# Altium project Power-PCB-v1.0.PrjPcb (part 2 of 2)

## Sheet Main_Power_Sheet.SchDoc
size 420 x 297 mm; SheetNumber: 2; SheetTotal: 3
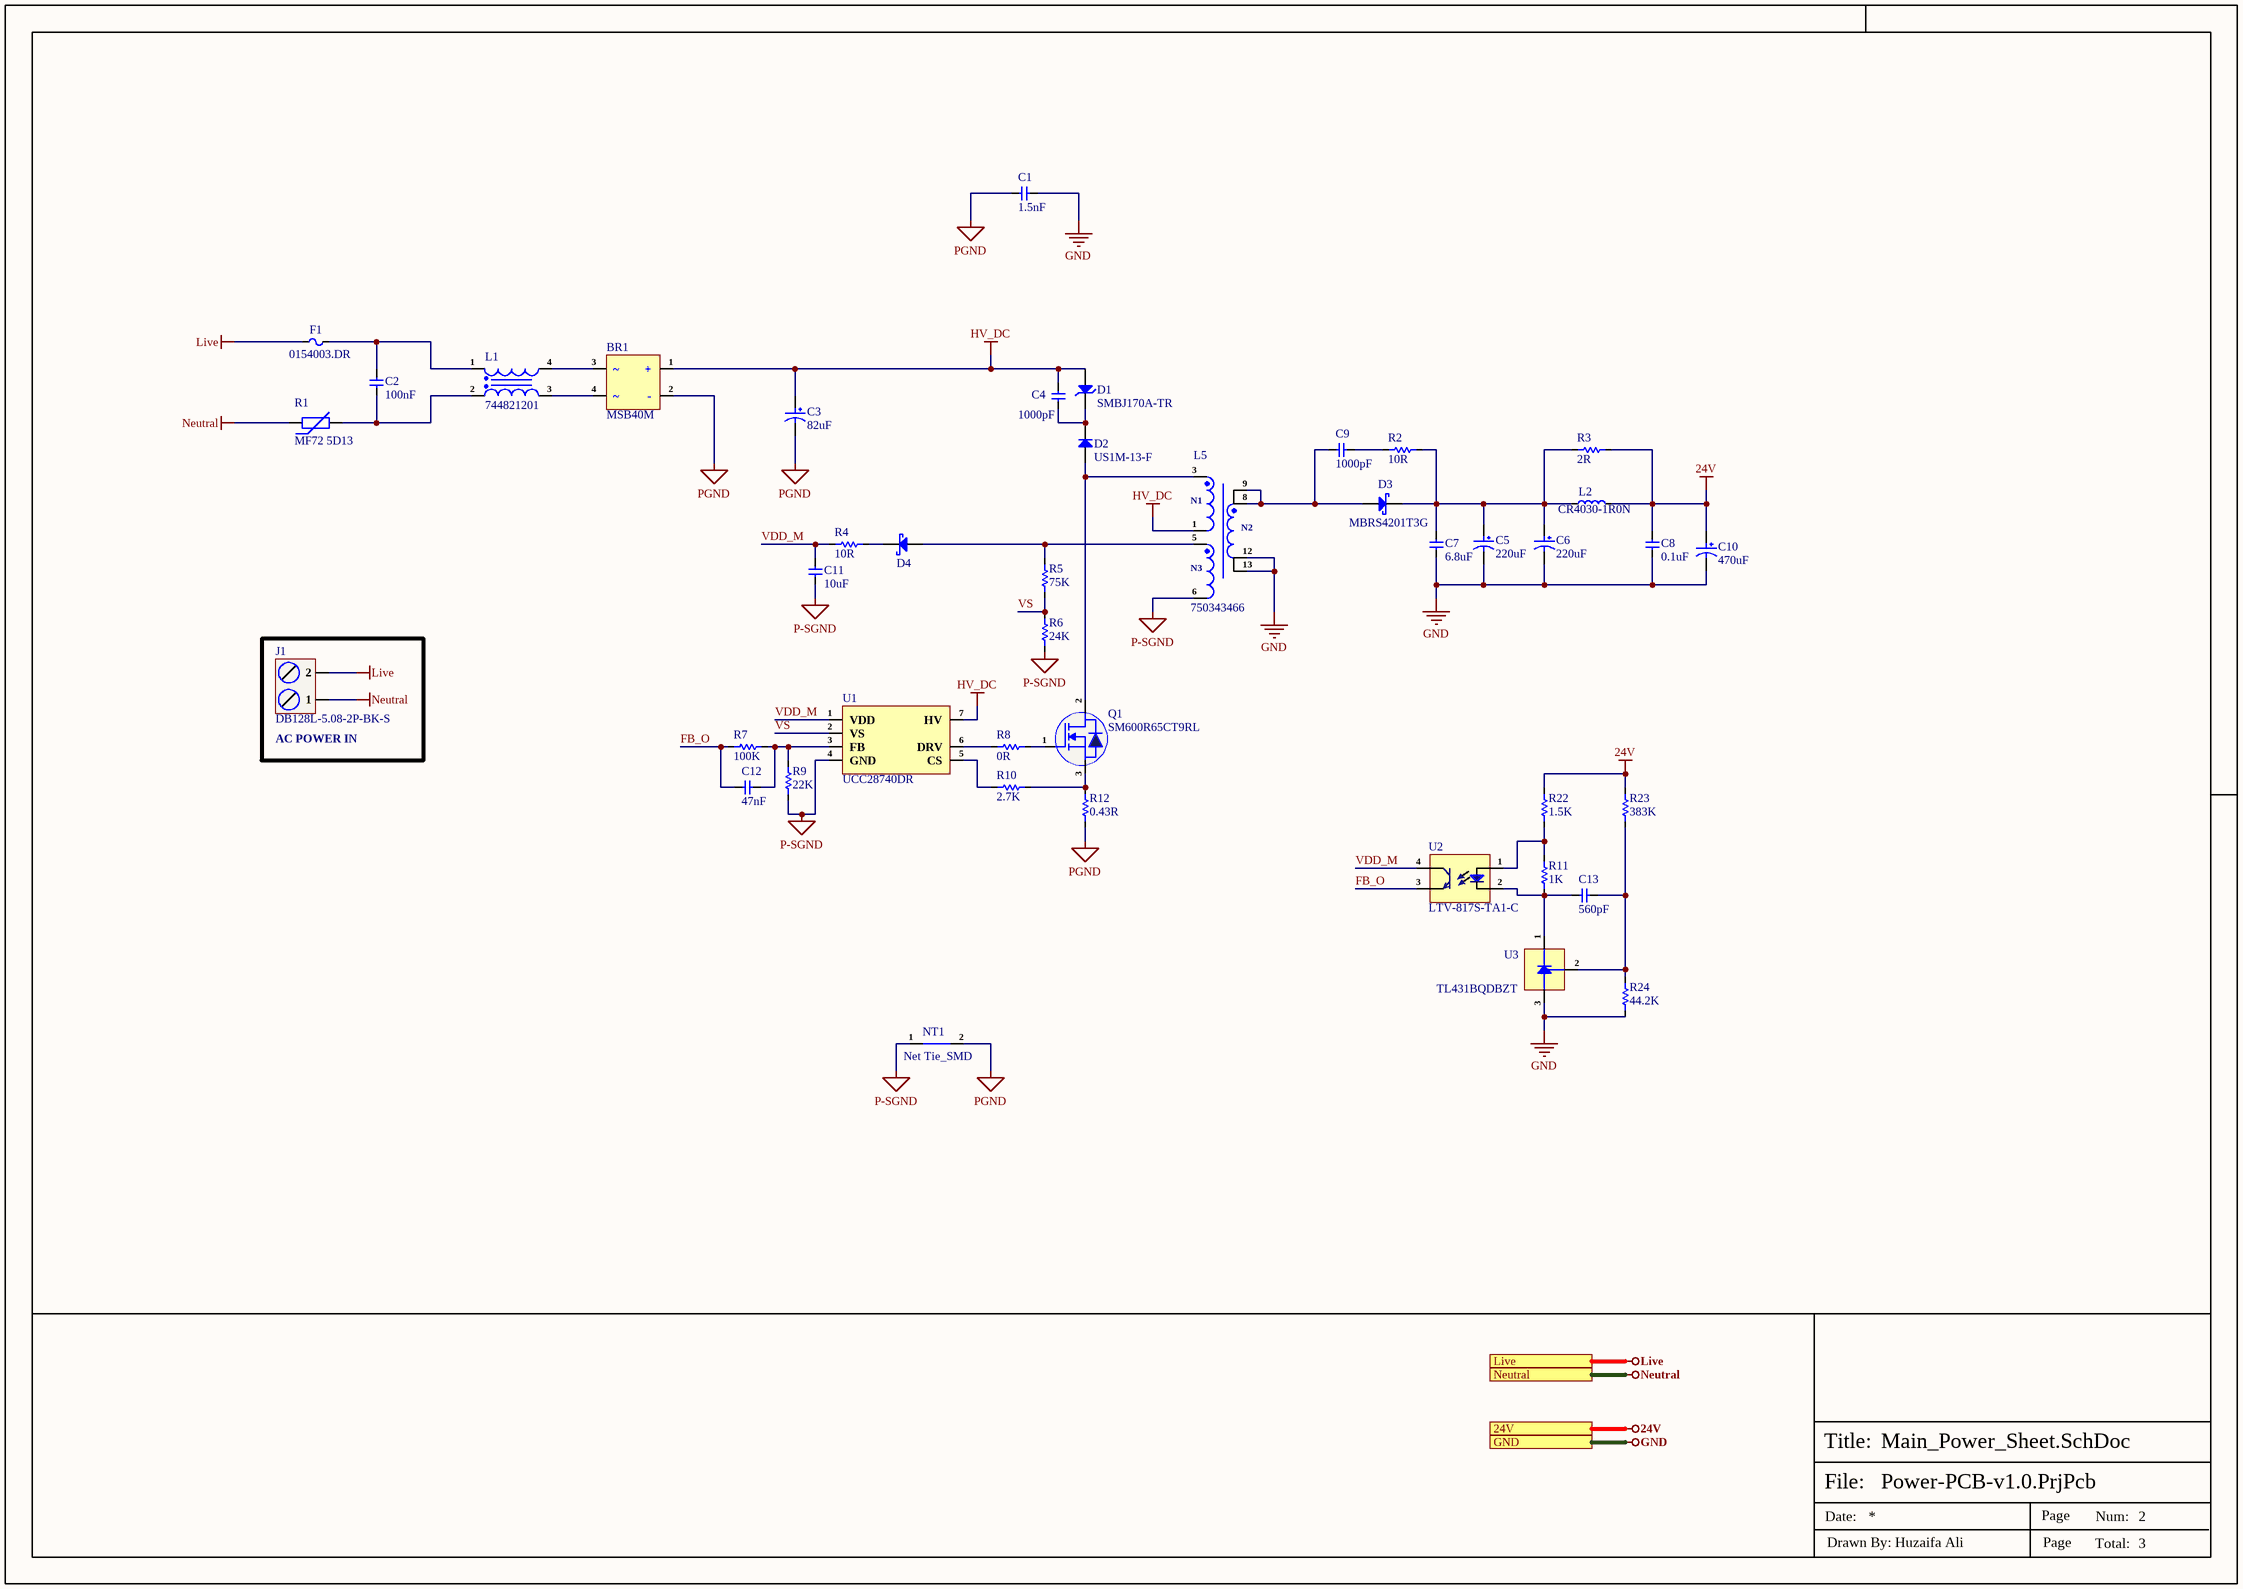
[diagram p2: Main_Power_Sheet.SchDoc]

### Parts
BR1  MSB40M  [UMSB]
C1  1.5nF  [DCF152M36Y5UG6BL0AA]
C2  100nF  [MP2104K27C3X6LC]
C3  82uF  [LKML2002E820MF]
C4  1000pF  [Cap-0805]
C5  220uF  [35ZLH220MEFC8X11.5]
C6  220uF  [35ZLH220MEFC8X11.5]
C7  6.8uF  [Cap-1206]
C8  0.1uF  [Cap-0603]
C9  1000pF  [Cap-0805]
C10  470uF  [ELXZ350ELL471MJ20S]
C11  10uF  [Cap-0805]
C12  47nF  [Cap-0603]
C13  560pF  [Cap-0603]
D1  SMBJ170A-TR  [SMB_]
D2  US1M-13-F  [SMA(DO-214AC)]
D3  MBRS4201T3G  [SMC]
D4  PMEG10010ELRX  [SOD-123W]  (value not drawn)
F1  0154003.DR  [0154003.DR]
J1  DB128L-5.08-2P-BK-S  [DB128L-5.08-2P-BK-S]
L1  744821201  [744821201]
L2  CR4030-1R0N  [CR4030-1R0N]
L5  750343466  [750343466]
NT1  Net Tie_SMD  [Net Tie Pad]  (net tie, no BOM)
Q1  SM600R65CT9RL  [TO-252-2L]
R1  MF72 5D13  [MF72 5D13]
R2  10R  [RES-0805]
R3  2R  [Res-1206]
R4  10R  [RES-0805]
R5  75K  [Res-0603]
R6  24K  [Res-0603]
R7  100K  [Res-0603]
R8  0R  [Res-0603]
R9  22K  [Res-0603]
R10  2.7K  [Res-0603]
R11  1K  [Res-0603]
R12  0.43R  [Res-1206]
R22  1.5K  [Res-0603]
R23  383K  [RES-0805]
R24  44.2K  [Res-0603]
U1  UCC28740DR  [7-SOIC]
U2  LTV-817S-TA1-C  [LTV-817S-TA1-C]
U3  TL431BQDBZT  [SOT-23]

### Blocks framed on the sheet
AC POWER IN: J1

### Ports
24V (see Top_Sheet[2B], DRIVER_BUC_Sheet[4D]), GND (see Top_Sheet[2B], DRIVER_BUC_Sheet[4D]), Live (see Top_Sheet[2B]), Neutral (see Top_Sheet[2B])

### Nets
24V: C8.2 C10.1 L2.2 R3.2 R22.2 R23.2 ; port 24V
GND: C1.2 C5.2 C6.2 C7.1 C8.1 C10.2 L5.12 L5.13 R24.1 U3.3(Anode) ; port GND
HV_DC: BR1.1(+) C3.1 C4.2 D1.1(A) L5.1 U1.7(HV)
Live: F1.1 J1.2 ; port Live
Neutral: J1.1 R1.1 ; port Neutral
P-SGND: C11.1 L5.6 NT1.1 R6.1 R9.1 U1.4(GND)
PGND: BR1.2(-) C1.1 C3.2 NT1.2 R12.1
FB_O: C12.1 R7.1 U2.3(E)
VDD_M: C11.2 R4.1 U1.1(VDD) U2.4(C)
VS: R5.1 R6.2 U1.2(VS)
NetBR1_3: BR1.3 L1.4
NetBR1_4: BR1.4 L1.3
NetC2_1: C2.1 L1.2 R1.2
NetC2_2: C2.2 F1.2 L1.1
NetC4_1: C4.1 D1.2(K) D2.1(K)
NetC5_1: C5.1 C6.1 C7.2 D3.1(K) L2.1 R2.2 R3.1
NetC9_1: C9.1 D3.2(A) L5.8 L5.9
NetC9_2: C9.2 R2.1
NetC12_2: C12.2 R7.2 R9.2 U1.3(FB)
NetC13_1: C13.1 R11.1 U2.2(Ca) U3.1(Cathode)
NetC13_2: C13.2 R23.1 R24.2 U3.2(REF)
NetD2_2: D2.2(A) L5.3 Q1.2(D)
NetD4_1: D4.1(A) L5.5 R5.2
NetD4_2: D4.2(K) R4.2
NetQ1_1: Q1.1(G) R8.2
NetQ1_3: Q1.3(S) R10.2 R12.2
NetR8_1: R8.1 U1.6(DRV)
NetR10_1: R10.1 U1.5(CS)
NetR11_2: R11.2 R22.1 U2.1(An)

### Notes on the sheet
- File:
- Title:
- Date:
- Page
- Num:
- Total:
- Drawn By: Huzaifa Ali
- (in symbol 750343466) N1; N2; N3

### Library data of the parts
BR1 = MSB40M: 1.1V@4A 4A 1000V UMSB Bridge Rectifiers ROHS; Manufacturer: GOODWORK; Item Type: Bridge Rectifire; Manufacturer Part Number: MSB40M; Package: UMSB; LCSC Part Number: C2985033; ComponentLink1Description: LCSC; ComponentLink1URL: https://www.lcsc.com/product-detail/Bridge-Rectifiers_GOODWORK-MSB40M_C2985033.html
C1 = DCF152M36Y5UG6BL0AA: 1.5nF ±20% X1,Y1 Plugin,P=10mm Safety Capacitors ROHS; Manufacturer: SHM; Manufacturer Part Number: DCF152M36Y5UG6BL0AA; Package: Plugin,P=10mm; LCSC Part Number: C2919099; Item Type: Capacitor; ComponentLink1Description: LCSC; ComponentLink1URL: https://www.lcsc.com/product-detail/Safety-Capacitors_SHM-DCF152M36Y5UG6BL0AA_C2919099.html?s_z=n_DE2E3KY152MN3AM02F
C2 = MP2104K27C3X6LC: 100nF ±10% X2 275V Plugin,P=10mm Safety Capacitors ROHS; Manufacturer: SRD(Shenzhen Sincerity Tech); Manufacturer Part Number: MP2104K27C3X6LC; Package: Plugin,P=10mm; LCSC Part Number: C105759; Item Type: Capacitor; ComponentLink1Description: LCSC; ComponentLink1URL: https://www.lcsc.com/product-detail/Safety-Capacitors_SRD-Shenzhen-Sincerity-Tech-MP2104K27C3X6LC_C105759.html
C3 = LKML2002E820MF: 82uF 250V 1.35Ω@100kHz ±20% 1.27A@100kHz Plugin,D12.5xL20mm Aluminum Electrolytic Capacitors - Leaded ROHS; Manufacturer: Ymin; Manufacturer Part Number: LKML2002E820MF; Package: Plugin,D12.5xL20mm; LCSC Part Number: C443261; Item Type: Capacitor; ComponentLink1Description: LCSC; ComponentLink1URL: https://www.lcsc.com/product-detail/Aluminum-Electrolytic-Capacitors-Leaded_Ymin-LKML2002E820MF_C443261.html
C4 C9 = 0805B102K631NT: 630V 1000pF X7R ±10% 0805 Multilayer Ceramic Capacitors MLCC - SMD/SMT ROHS; Manufacturer: FH (Guangdong Fenghua Advanced Tech); Manufacturer Part Number: 0805B102K631NT; Package: 0805; LCSC Part Number: C20617885; Item Type: Capacitor; ComponentLink1Description: LCSC; ComponentLink1URL: https://www.lcsc.com/product-detail/Multilayer-Ceramic-Capacitors-MLCC-SMD-SMT_FH-Guangdong-Fenghua-Advanced-Tech-0805B102K631NT_C20617885.html?s_z=n_%2520C0805C102JBRACTU
C5 C6 = 35ZLH220MEFC8X11.5: 220uF 35V 472.5mA@120Hz ±20% Plugin,D8xL11.5mm Aluminum Electrolytic Capacitors - Leaded ROHS; Manufacturer: Rubycon; Manufacturer Part Number: 35ZLH220MEFC8X11.5; Package: Plugin,D8xL11.5mm; LCSC Part Number: C107639; Item Type: Capacitor; ComponentLink1Description: LCSC; ComponentLink1URL: https://www.lcsc.com/product-detail/Aluminum-Electrolytic-Capacitors-Leaded_Rubycon-35ZLH220MEFC8X11-5_C107639.html?s_z=n_EKZE350ELL221MJC5S
C7 = C3216X7R1V685KT000E: CAP CER 6.8UF 35V X7R 1206; Manufacturer: TDK Corporation; Manufacturer Part Number: C3216X7R1V685K160AC; Item Type: Capacitor; Package: 1206; LCSC Part Number: C342646; ComponentLink1Description: LCSC; ComponentLink1URL: https://www.lcsc.com/product-detail/Multilayer-Ceramic-Capacitors-MLCC-SMD-SMT_TDK-C3216X7R1V685KT000E_C342646.html?s_z=n_C2012X5R1V685K125AC
C8 = GCM188R71H104KA57J: CAP CER 0.1UF 50V X7R 0603; Manufacturer: Murata; Item Type: Capacitors; Material: 4241ConductorMaterial; Value: 100nF; Tolerance: 10%; Supplier: Mouser; LCSC Part Number: 81-GCM188R71H104KA7J; Manufacturer Part Number: GCM188R71H104KA57J; RoHS: Yes; Stock: 469972; Pricing: 1=0.19, 10=0.121, 50=0.121, 100=0.064, 1000=0.051, 10000=0.035 (USD); Mounting Technology: Surface Mount; Case/Package: 0603; Case Code (Metric): 1608; Case Code (Imperial): 0603; Min Operating Temperature: -55°C; Max Operating Temperature: 125°C; Dielectric: X7R; Package Quantity: 1; Packaging: Tape and Reel; Voltage Rating: 50V; Voltage Rating (DC): 50V; Termination: SMD/SMT; Series: GCM; Construction: Flat; Length: 1.6mm; Width: 0.031inch; Height: 0.8mm; Thickness: 0.035inch; Depth: 0.8mm; Ratings: AEC-Q200; Radiation Hardening: No; RoHS Compliant: Yes; Lead Free: 5697LeadFree; ComponentLink1URL: https://datasheet.ciiva.com/29540/product-29540815.pdf?src-supplier=Digikey; ComponentLink1Description: https://datasheet.ciiva.com/29540/product-29540815.pdf?src-supplier=Digikey; ComponentLink2URL: https://datasheet.ciiva.com/11618/product-11618920.pdf?src-supplier=Avnet; ComponentLink2Description: https://datasheet.ciiva.com/11618/product-11618920.pdf?src-supplier=Avnet
C10 = ELXZ350ELL471MJ20S: CAP ALUM 470UF 20% 35V RADIAL; Item Type: Capacitor; Dielectric Material: Aluminium; Ripple Current: 1.22A; ESR (Equivalent Series Resistance): 52mR; Life (Hours): 5000Hour; Lead Diameter: 0.6mm; LCSC Part Number: C1669323; ComponentLink1Description: LCSC; Supplier: Rs; Supplier Part Number: 390120; RoHS: Yes; Category: Aluminum Electrolytic Capacitors; Stock: 615; Pricing: 5=0.094, 25=0.54, 50=0.512, 100=0.488, 250=0.476 (GBP); Mounting Technology: Through Hole; Case/Package: Radial; Min Operating Temperature: -55°C; Max Operating Temperature: 105°C; Value: 470uF; Tolerance: 20%; Voltage Rating: 35V; Package Quantity: 2000; Packaging: Bulk; Impedance: 52mR; Termination: Radial; Voltage Rating (DC): 35V; Series: LXZ; Construction: RADIAL; Diameter: 10mm; Length: 20mm; Height: 20mm; Lead Pitch: 5mm; Ratings: AEC-Q200; Radiation Hardening: No; Lead Free: Lead Free; RoHS Compliant: Yes; Reach SVHC Compliant: Unknown; ComponentLink2URL: https://datasheet.ciiva.com/15165/getdatasheetpartid-102547-15165912.pdf?src-supplier=Verical; ComponentLink2Description: https://datasheet.ciiva.com/15165/getdatasheetpartid-102547-15165912.pdf?src-supplier=Verical; ComponentLink3URL: https://datasheet.ciiva.com/15948/20cat-db-al-cgieejppdfnamelxz-cgieejppdfnamelxz-15948790.pdf?src-supplier=Onlinecomponents.com; ComponentLink3Description: https://datasheet.ciiva.com/15948/20cat-db-al-cgieejppdfnamelxz-cgieejppdfnamelxz-15948790.pdf?src-supplier=Onlinecomponents.com; ComponentLink4URL: https://datasheet.ciiva.com/22620/1697097-22620536.pdf?src-supplier=Element14; ComponentLink4Description: https://datasheet.ciiva.com/22620/1697097-22620536.pdf?src-supplier=Element14; ComponentLink5URL: https://datasheet.ciiva.com/7910/1348889-7910316.pdf?src-supplier=Element14; ComponentLink5Description: https://datasheet.ciiva.com/7910/1348889-7910316.pdf?src-supplier=Element14; ComponentLink6URL: https://datasheet.ciiva.com/29247/447742-da-01-en-elko-470-uf-35v-105c-2000st-29247655.pdf?src-supplier=Conrad; ComponentLink6Description: https://datasheet.ciiva.com/29247/447742-da-01-en-elko-470-uf-35v-105c-2000st-29247655.pdf?src-supplier=Conrad
C11 = CGA0805X5R106K350MT: 35V 10uF X5R ±10% 0805 Multilayer Ceramic Capacitors MLCC - SMD/SMT ROHS; Manufacturer: HRE; Manufacturer Part Number: CGA0805X5R106K350MT; Package: 0805; LCSC Part Number: C6119888; Item Type: Capacitor; ComponentLink1Description: LCSC; ComponentLink1URL: https://www.lcsc.com/product-detail/Multilayer-Ceramic-Capacitors-MLCC-SMD-SMT_HRE-CGA0805X5R106K350MT_C6119888.html?s_z=n_C2012X5R1V106K085AC
C12 = CC0603KRX7R9BB473: CAP CER 0.047UF 50V X7R 0603; Manufacturer: Yageo; Item Type: Capacitors; Material: 4241ConductorMaterial; Supplier: Future Electronics; LCSC Part Number: C107093; Manufacturer Part Number: CC0603KRX7R9BB473; RoHS: Yes; Stock: 2716000; Pricing: 4000=0.003, 16000=0.0029, 60000=0.0028, 160000=0.0027, 400000=0.0026 (USD); Lead Free: 5697LeadFree; Halogen Free: 5694HalogenFree; ComponentLink1URL: https://datasheet.ciiva.com/26862/getdatasheetpartid-403593-26862863.pdf?src-supplier=Verical; ComponentLink1Description: https://datasheet.ciiva.com/26862/getdatasheetpartid-403593-26862863.pdf?src-supplier=Verical; ComponentLink2URL: https://datasheet.ciiva.com/11786/0900766b80d84f1d-11786072.pdf?src-supplier=Rs; ComponentLink2Description: https://datasheet.ciiva.com/11786/0900766b80d84f1d-11786072.pdf?src-supplier=Rs; ComponentLink3URL: https://datasheet.ciiva.com/176/mlccorderingcode-176544.pdf?src-supplier=Digikey; ComponentLink3Description: https://datasheet.ciiva.com/176/mlccorderingcode-176544.pdf?src-supplier=Digikey; ComponentLink4URL: https://datasheet.ciiva.com/176/mlccorderingcode-176545.pdf?src-supplier=Digikey; ComponentLink4Description: https://datasheet.ciiva.com/176/mlccorderingcode-176545.pdf?src-supplier=Digikey; ComponentLink5URL: https://datasheet.ciiva.com/176/mlccorderingcode-176546.pdf?src-supplier=Digikey; ComponentLink5Description: https://datasheet.ciiva.com/176/mlccorderingcode-176546.pdf?src-supplier=Digikey; ComponentLink6URL: https://datasheet.ciiva.com/28450/1489800-28450670.pdf?src-supplier=Element14; ComponentLink6Description: https://datasheet.ciiva.com/28450/1489800-28450670.pdf?src-supplier=Element14
C13 = CC0603KRX7R9BB561: CAP CER 560PF 50V X7R 0603; Manufacturer: Yageo; Item Type: Capacitors; Material: 4241ConductorMaterial; Insulation Resistance: 100GR; Supplier: Digikey; LCSC Part Number: C107094; Manufacturer Part Number: CC0603KRX7R9BB561; RoHS: Yes; Stock: 209062; Pricing: 1=0.1, 10=0.035, 100=0.0204, 1000=0.01285 (USD); Dielectric Material: 4241ConductorMaterial; Voltage Rating (AC): 50V; Lead Free: 5697LeadFree; Halogen Free: 5694HalogenFree; ComponentLink1URL: https://datasheet.ciiva.com/8033/1489800-8033866.pdf?src-supplier=Element14; ComponentLink1Description: https://datasheet.ciiva.com/8033/1489800-8033866.pdf?src-supplier=Element14; ComponentLink2URL: https://datasheet.ciiva.com/144/mlccorderingcode-144466.pdf?src-supplier=Digikey; ComponentLink2Description: https://datasheet.ciiva.com/144/mlccorderingcode-144466.pdf?src-supplier=Digikey; ComponentLink3URL: https://datasheet.ciiva.com/144/mlccorderingcode-144467.pdf?src-supplier=Digikey; ComponentLink3Description: https://datasheet.ciiva.com/144/mlccorderingcode-144467.pdf?src-supplier=Digikey; ComponentLink4URL: https://datasheet.ciiva.com/144/mlccorderingcode-144468.pdf?src-supplier=Digikey; ComponentLink4Description: https://datasheet.ciiva.com/144/mlccorderingcode-144468.pdf?src-supplier=Digikey; ComponentLink5URL: https://datasheet.ciiva.com/11465/upy-gphc-x7r-6-3v-to-50v-8-11465256.pdf?src-supplier=Avnet; ComponentLink5Description: https://datasheet.ciiva.com/11465/upy-gphc-x7r-6-3v-to-50v-8-11465256.pdf?src-supplier=Avnet
D1 = SMBJ170A-TR: TVS DIODE 170VWM 275VC SMB; Manufacturer: STMicroelectronics; Item Type: TVS Diodes; Supplier: Mouser; LCSC Part Number: C1973536; Manufacturer Part Number: SMBJ170A-TR; RoHS: Yes; Stock: 8410; Pricing: 1=0.3, 10=0.231, 50=0.231, 100=0.167, 1000=0.122, 10000=0.115 (USD); ComponentLink1URL: https://datasheet.ciiva.com/30514/2017842-30514067.pdf?src-supplier=Jameco; ComponentLink1Description: https://datasheet.ciiva.com/30514/2017842-30514067.pdf?src-supplier=Jameco; ComponentLink2URL: https://datasheet.ciiva.com/337/cd00001366-337837.pdf?src-supplier=Digikey; ComponentLink2Description: https://datasheet.ciiva.com/337/cd00001366-337837.pdf?src-supplier=Digikey; ComponentLink3URL: https://datasheet.ciiva.com/337/cd00001366-337838.pdf?src-supplier=Digikey; ComponentLink3Description: https://datasheet.ciiva.com/337/cd00001366-337838.pdf?src-supplier=Digikey; ComponentLink4URL: https://datasheet.ciiva.com/337/cd00001366-337839.pdf?src-supplier=Digikey; ComponentLink4Description: https://datasheet.ciiva.com/337/cd00001366-337839.pdf?src-supplier=Digikey; ComponentLink5URL: https://datasheet.ciiva.com/7973/1761316-7973541.pdf?src-supplier=Element14; ComponentLink5Description: https://datasheet.ciiva.com/7973/1761316-7973541.pdf?src-supplier=Element14; ComponentLink6URL: https://datasheet.ciiva.com/7973/1761316-7973543.pdf?src-supplier=Element14; ComponentLink6Description: https://datasheet.ciiva.com/7973/1761316-7973543.pdf?src-supplier=Element14; ComponentLink7URL: https://datasheet.ciiva.com/26817/getdatasheetpartid-82970-26817756.pdf?src-supplier=Verical; ComponentLink7Description: https://datasheet.ciiva.com/26817/getdatasheetpartid-82970-26817756.pdf?src-supplier=Verical; ComponentLink8URL: https://datasheet.ciiva.com/16487/cd00001366-16487614.pdf?src-supplier=Future+Electronics; ComponentLink8Description: https://datasheet.ciiva.com/16487/cd00001366-16487614.pdf?src-supplier=Future+Electronics; ComponentLink9URL: https://datasheet.ciiva.com/14535/70014015-14535806.pdf?src-supplier=Allied+Electronics; ComponentLink9Description: https://datasheet.ciiva.com/14535/70014015-14535806.pdf?src-supplier=Allied+Electronics
D2 = US1M-13-F: DIODE STANDARD 1000V 1A SMA; Manufacturer: Diodes; Value: 10pF; Polarity: 4901Direction; Voltage Rating (DC): 1kV; Supplier: Avnet; LCSC Part Number: C99333; Manufacturer Part Number: US1M-13-F; RoHS: Yes; Item Type: Diodes; Stock: 29030000; Pricing: 5000=0.02564, 10000=0.02516, 20000=0.02503, 30000=0.0249, 40000=0.02477 (USD); Current Rating: 1A; Output Current: 1A; Reverse Voltage: 1kV; Lead Free: 5697LeadFree; ComponentLink1URL: https://datasheet.ciiva.com/27052/1542696-27052440.pdf?src-supplier=Jameco; ComponentLink1Description: https://datasheet.ciiva.com/27052/1542696-27052440.pdf?src-supplier=Jameco; ComponentLink2URL: https://datasheet.ciiva.com/4454/ds16008-60440-4454096.pdf?src-supplier=Mouser; ComponentLink2Description: https://datasheet.ciiva.com/4454/ds16008-60440-4454096.pdf?src-supplier=Mouser; ComponentLink3URL: https://datasheet.ciiva.com/8301/ds16008-8301519.pdf?src-supplier=Avnet; ComponentLink3Description: https://datasheet.ciiva.com/8301/ds16008-8301519.pdf?src-supplier=Avnet; ComponentLink4URL: https://datasheet.ciiva.com/8303/ds16008-8303103.pdf?src-supplier=Avnet; ComponentLink4Description: https://datasheet.ciiva.com/8303/ds16008-8303103.pdf?src-supplier=Avnet; ComponentLink5URL: https://datasheet.ciiva.com/917/ds16008-917195.pdf?src-supplier=Digikey; ComponentLink5Description: https://datasheet.ciiva.com/917/ds16008-917195.pdf?src-supplier=Digikey; ComponentLink6URL: https://datasheet.ciiva.com/917/ds16008-917196.pdf?src-supplier=Digikey; ComponentLink6Description: https://datasheet.ciiva.com/917/ds16008-917196.pdf?src-supplier=Digikey; ComponentLink7URL: https://datasheet.ciiva.com/22695/1906610-22695853.pdf?src-supplier=Element14; ComponentLink7Description: https://datasheet.ciiva.com/22695/1906610-22695853.pdf?src-supplier=Element14
D3 = MBRS4201T3G: 200V Independent Type 4A 860mV@4A SMC(DO-214AB) Schottky Diodes ROHS; Manufacturer: FUXINSEMI; Item Type: Diode; Manufacturer Part Number: MBRS4201T3G; Package: SMC(DO-214AB); LCSC Part Number: C5563749; ComponentLink1Description: LCSC; ComponentLink1URL: https://www.lcsc.com/product-detail/Schottky-Diodes_FUXINSEMI-MBRS4201T3G_C5563749.html?s_z=n_%2520MBRS4201T3G
D4 = PMEG10010ELRX: DIODE SCHOTTKY 100V 1A SOD123W; Manufacturer: Nexperia; Item Type: Schottky Diodes; Reverse Recovery Time: 3.7ns; Value: 28pF; Max Forward Surge Current (Ifsm): 50A; Max Reverse Current: 150nA; Supplier: Future Electronics; LCSC Part Number: C179426; Manufacturer Part Number: PMEG10010ELRX; RoHS: Yes; Stock: 282000; Pricing: 3000=0.0482, 9000=0.047, 15000=0.0464, 30000=0.0457, 60000=0.0446 (USD); Mounting Technology: 8Mount; Average Rectified Current: 1A; Max Reverse Voltage (DC): 100V; Forward Current: 1A; Reverse Voltage: 100V; Height: 1.1mm; RoHS Compliant: Yes; Lead Free: 5697LeadFree; Reach SVHC Compliant: 4186SVHC; ComponentLink1URL: http://www.farnell.com/datasheets/2170364.pdf?src-supplier=Farnell; ComponentLink1Description: http://www.farnell.com/datasheets/2170364.pdf?src-supplier=Farnell; ComponentLink2URL: https://assets.nexperia.com/documents/data-sheet/PMEG10010ELR.pdf?src-supplier=Digikey; ComponentLink2Description: https://assets.nexperia.com/documents/data-sheet/PMEG10010ELR.pdf?src-supplier=Digikey; ComponentLink3URL: https://datasheet.octopart.com/PMEG10010ELRX-Nexperia-datasheet-67796196.pdf?src-supplier=Future+Electronics; ComponentLink3Description: https://datasheet.octopart.com/PMEG10010ELRX-Nexperia-datasheet-67796196.pdf?src-supplier=Future+Electronics; ComponentLink4URL: http://www.farnell.com/datasheets/2170364.pdf?src-supplier=Newark; ComponentLink4Description: http://www.farnell.com/datasheets/2170364.pdf?src-supplier=Newark
F1 = 0154003.DR: FUSE BRD MNT 3A 125VAC/VDC 2SMD; Manufacturer: Littelfuse; Item Type: Fuses; Value: 22.7mR; Supplier: Digikey; LCSC Part Number: C206912; Manufacturer Part Number: 0154003.DR; RoHS: Yes; Stock: 5902; Pricing: 1=2.71, 5=2.246, 10=2.073, 50=1.7196, 100=1.5862, 250=1.425, 500=1.3135 (USD); Lead Free: 5697LeadFree; RoHS Compliant: 5897YesNo; Flammability Rating: 5813Flammability; ComponentLink1URL: https://datasheet.ciiva.com/29697/1708924-29697492.pdf?src-supplier=Jameco; ComponentLink1Description: https://datasheet.ciiva.com/29697/1708924-29697492.pdf?src-supplier=Jameco; ComponentLink2URL: https://datasheet.ciiva.com/14102/aa154xxx-data-e-14102960.pdf?src-supplier=Distrelec; ComponentLink2Description: https://datasheet.ciiva.com/14102/aa154xxx-data-e-14102960.pdf?src-supplier=Distrelec; ComponentLink3URL: https://datasheet.ciiva.com/28499/88932-28499727.pdf?src-supplier=Element14; ComponentLink3Description: https://datasheet.ciiva.com/28499/88932-28499727.pdf?src-supplier=Element14; ComponentLink4URL: https://datasheet.ciiva.com/1268/154-1268659.pdf?src-supplier=Element14; ComponentLink4Description: https://datasheet.ciiva.com/1268/154-1268659.pdf?src-supplier=Element14
J1 = DB128L-5.08-2P-BK-S: 1x2P 18A -40℃~+105℃ 250V Black 12~30 Straight pin 5.08mm 2.5 1 2 Plugin,P=5.08mm Screw terminal ROHS; Manufacturer: DIBO; Item Type: Terminal Block; Manufacturer Part Number: DB128L-5.08-2P-BK-S; Package: Plugin,P=5.08mm; LCSC Part Number: C430601; ComponentLink1Description: LCSC; ComponentLink1URL: https://www.lcsc.com/product-detail/Screw-terminal_span-style-background-color-ff0-DIBO-span-DB128L-5-08-2P-BK-S_C430601.html
L1 = 744821201: CMC 1MH 2A 2LN TH; Manufacturer: Wurth Electronics; Item Type: Fixed Inductors; Supplier: Mouser; Supplier Part Number: 710-744821201; Manufacturer Part Number: 744821201; RoHS: Yes; Stock: 341; Pricing: 1=3.6, 10=3.33, 50=2.98, 100=2.62, 1000=2.34, 10000=2.34 (USD); ComponentLink1URL: https://datasheet.ciiva.com/4952/744821201-87450-4952378.pdf?src-supplier=Mouser; ComponentLink1Description: https://datasheet.ciiva.com/4952/744821201-87450-4952378.pdf?src-supplier=Mouser; ComponentLink2URL: https://datasheet.ciiva.com/1008/744821201-1008592.pdf?src-supplier=Digikey; ComponentLink2Description: https://datasheet.ciiva.com/1008/744821201-1008592.pdf?src-supplier=Digikey; ComponentLink3URL: https://datasheet.ciiva.com/11796/0900766b804ac268-11796620.pdf?src-supplier=Rs; ComponentLink3Description: https://datasheet.ciiva.com/11796/0900766b804ac268-11796620.pdf?src-supplier=Rs; ComponentLink4URL: https://datasheet.ciiva.com/7211/70377-7211245.pdf?src-supplier=Newark; ComponentLink4Description: https://datasheet.ciiva.com/7211/70377-7211245.pdf?src-supplier=Newark; ComponentLink5URL: https://datasheet.ciiva.com/7892/1736513-7892972.pdf?src-supplier=Element14; ComponentLink5Description: https://datasheet.ciiva.com/7892/1736513-7892972.pdf?src-supplier=Element14; ComponentLink6URL: https://datasheet.ciiva.com/14124/to744821201-data-de-14124987.pdf?src-supplier=Distrelec; ComponentLink6Description: https://datasheet.ciiva.com/14124/to744821201-data-de-14124987.pdf?src-supplier=Distrelec
L2 = CR4030-1R0N: 3.4A 1uH ±30% 5.9A SMD,4x4mm Power Inductors ROHS; Manufacturer: Ceaiya; Manufacturer Part Number: CR4030-1R0N; Package: SMD,4x4mm; LCSC Part Number: C520322; Item Type: Inductor; ComponentLink1Description: LCSC; ComponentLink1URL: https://www.lcsc.com/product-detail/Power-Inductors_Ceaiya-CR4030-1R0N_C520322.html?s_z=n_B82462G4102M
L5 = 750343466: XFMR FLYBACK AC/DC CONV 280UH TH; Manufacturer: Wurth Electronics; Item Type: Transformer; Supplier: Digikey; Supplier Part Number: 1297-750343466-ND; Manufacturer Part Number: 750343466; RoHS: Yes; Stock: 112; Pricing: 1=7.36, 10=6.646, 25=6.3768, 70=6.08471, 140=5.89457, 280=5.70964, 490=5.56402, 980=5.38821 (USD); RoHS Compliant: Yes
NT1 = Net Tie_SMD: Net Tie SMD; Manufacturer Part Number: Net Tie; Item Type: Net Tie Pad
Q1 = SM600R65CT9RL: 650V 7A 0.6Ω@10V,3.5A 63W 4V 1 N-channel TO-252-2 MOSFETs ROHS; Manufacturer: SPS; Item Type: Mosfet; Manufacturer Part Number: SM600R65CT9RL; Package: TO-252-2; LCSC Part Number: C509119; ComponentLink1Description: LCSC; ComponentLink1URL: https://www.lcsc.com/product-detail/MOSFETs_SPS-SM600R65CT9RL_C509119.html?s_z=n_TK7P65W
R1 = MF72 5D13: 5Ω 5A 4W 2800K ±10% Plugin,P=7.5mm NTC Thermistors ROHS; Manufacturer: Nanjing Shiheng Elec; Manufacturer Part Number: MF72 5D13; Package: Plugin,P=7.5mm; LCSC Part Number: C72683; Item Type: Thermistor; ComponentLink1Description: LCSC; ComponentLink1URL: https://www.lcsc.com/product-detail/NTC-Thermistors_Nanjing-Shiheng-Elec-MF72-5D13_C72683.html?s_z=n_B57236
R2 R4 = RC0805JR-0710RL: RES 10 OHM 5% 1/8W 0805; Manufacturer: Yageo; Item Type: Resistors; Temperature Coefficient: 200ppm/°C; Voltage Rating: 150V; Power Rating: 125mW; Supplier: Avnet; LCSC Part Number: C137478; Manufacturer Part Number: RC0805JR-0710RL; RoHS: Yes; Stock: 75000; Pricing: 5000=0.00455, 10000=0.00448, 20000=0.00441, 30000=0.00434, 40000=0.00427 (USD); Case/Package: 0805; Contact Plating: Tin,Lead; Case Code (Imperial): 0805; Case Code (Metric): 2012; Min Operating Temperature: -55°C; Max Operating Temperature: 155°C; Tolerance: 5%; Value: 10R; Packaging: Tape and Reel; Resistor Type: Thick Film; Package Quantity: 1; Termination: SMD/SMT; Number of Terminations: 2; Max Power Dissipation: 125mW; Features: Moisture Resistant; Series: RC; Resistance Tolerance: 5%; Length: 0.079inch; Width: 0.049inch; Height: 0.024inch; Lead Free: Lead Free; RoHS Compliant: Yes; Reach SVHC Compliant: Unknown; ComponentLink1URL: https://datasheet.ciiva.com/46395/444164-46395129.pdf?src-supplier=Element14; ComponentLink1Description: https://datasheet.ciiva.com/46395/444164-46395129.pdf?src-supplier=Element14; ComponentLink2URL: https://datasheet.ciiva.com/2456/pyu-r-int-thick-7-2456041.pdf?src-supplier=Digikey; ComponentLink2Description: https://datasheet.ciiva.com/2456/pyu-r-int-thick-7-2456041.pdf?src-supplier=Digikey; ComponentLink3URL: https://datasheet.ciiva.com/2456/pyu-r-int-thick-7-2456042.pdf?src-supplier=Digikey; ComponentLink3Description: https://datasheet.ciiva.com/2456/pyu-r-int-thick-7-2456042.pdf?src-supplier=Digikey; ComponentLink4URL: https://datasheet.ciiva.com/2456/pyu-r-int-thick-7-2456040.pdf?src-supplier=Digikey; ComponentLink4Description: https://datasheet.ciiva.com/2456/pyu-r-int-thick-7-2456040.pdf?src-supplier=Digikey; ComponentLink5URL: https://datasheet.ciiva.com/12667/rc0805-12667031.pdf?src-supplier=Mouser; ComponentLink5Description: https://datasheet.ciiva.com/12667/rc0805-12667031.pdf?src-supplier=Mouser
R3 = FRC1206F2R00TS: 0.25W Thick Film Resistors 200V ±1% ±200ppm/℃ 2Ω 1206 Chip Resistor - Surface Mount ROHS; Manufacturer: FOJAN; Manufacturer Part Number: FRC1206F2R00TS; Package: 1206; LCSC Part Number: C2907381; Item Type: Resistor; ComponentLink1Description: LCSC; ComponentLink1URL: https://www.lcsc.com/product-detail/Chip-Resistor-Surface-Mount_FOJAN-FRC1206F2R00TS_C2907381.html?s_z=n_CRCW12062R00FKEA
R5 = RC0603FR-0775KL: RES 75K OHM 1% 1/10W 0603; Manufacturer: Yageo; Item Type: Resistor; Value: 75kR; Power Rating: 100mW; Voltage Rating: 50V; Temperature Coefficient: 100ppm/°C; Supplier: Future Electronics; LCSC Part Number: C114636; Manufacturer Part Number: RC0603FR-0775KL; RoHS: Yes; Stock: 550000; Pricing: 5000=0.0015, 75000=0.0015, 250000=0.0014, 750000=0.0013, 2500000=0.0012 (USD); Case/Package: 0603; Pins: 2NUMBER; Case Code (Imperial): 0603; Case Code (Metric): 1608; Min Operating Temperature: -55°C; Max Operating Temperature: 155°C; Tolerance: 1%; Packaging: Tape and Reel; Termination: SMD/SMT; Resistor Type: Thick Film; Number of Terminations: 2; Max Power Dissipation: 100mW; Features: Moisture Resistant; Series: RC; Technology: THICK FILM; Resistance Tolerance: 1%; Construction: Rectangular; Voltage Rating (DC): 50V; Length: 1.6mm; Height: 0.45mm; Depth: 0.8mm; RoHS Compliant: Yes; Reach SVHC Compliant: No; Military Standard: Not; Lead Free: 5697LeadFree; ComponentLink1URL: https://datasheet.ciiva.com/11808/0900766b80f96399-11808100.pdf?src-supplier=Rs; ComponentLink1Description: https://datasheet.ciiva.com/11808/0900766b80f96399-11808100.pdf?src-supplier=Rs; ComponentLink2URL: https://datasheet.ciiva.com/15189/getdatasheetpartid-326733-15189816.pdf?src-supplier=Verical; ComponentLink2Description: https://datasheet.ciiva.com/15189/getdatasheetpartid-326733-15189816.pdf?src-supplier=Verical; ComponentLink3URL: https://datasheet.ciiva.com/2455/pyu-r-int-thick-7-2455324.pdf?src-supplier=Digikey; ComponentLink3Description: https://datasheet.ciiva.com/2455/pyu-r-int-thick-7-2455324.pdf?src-supplier=Digikey; ComponentLink4URL: https://datasheet.ciiva.com/2455/pyu-r-int-thick-7-2455325.pdf?src-supplier=Digikey; ComponentLink4Description: https://datasheet.ciiva.com/2455/pyu-r-int-thick-7-2455325.pdf?src-supplier=Digikey; ComponentLink5URL: https://datasheet.ciiva.com/2455/pyu-r-int-thick-7-2455323.pdf?src-supplier=Digikey; ComponentLink5Description: https://datasheet.ciiva.com/2455/pyu-r-int-thick-7-2455323.pdf?src-supplier=Digikey; ComponentLink6URL: https://datasheet.ciiva.com/46395/443971-46395017.pdf?src-supplier=Element14; ComponentLink6Description: https://datasheet.ciiva.com/46395/443971-46395017.pdf?src-supplier=Element14
R6 = RC0603JR-0724KL: RES 24K OHM 5% 1/10W 0603; Manufacturer: Yageo; Item Type: Resistors; Supplier: Digikey; LCSC Part Number: C137644; Manufacturer Part Number: RC0603JR-0724KL; RoHS: Yes; Stock: 92506; Pricing: 1=0.1, 10=0.008, 50=0.0072, 100=0.0061, 500=0.0056, 1000=0.0051 (USD); ComponentLink1URL: http://www.mouser.com/catalog/specsheets/RC0603.pdf?src-supplier=Mouser; ComponentLink1Description: http://www.mouser.com/catalog/specsheets/RC0603.pdf?src-supplier=Mouser; ComponentLink2URL: http://www.yageo.com/documents/recent/PYu-RC_Group_51_RoHS_L_9.pdf?src-supplier=Digikey; ComponentLink2Description: http://www.yageo.com/documents/recent/PYu-RC_Group_51_RoHS_L_9.pdf?src-supplier=Digikey; ComponentLink3URL: http://www.yageo.com/documents/recent/PYu-RC_Group_51_RoHS_L_10.pdf?src-supplier=Digikey; ComponentLink3Description: http://www.yageo.com/documents/recent/PYu-RC_Group_51_RoHS_L_10.pdf?src-supplier=Digikey; ComponentLink4URL: http://www.yageo.com.tw/exep/pages/download/literatures/PYu-R_INT-thick_7.pdf?src-supplier=Digikey; ComponentLink4Description: http://www.yageo.com.tw/exep/pages/download/literatures/PYu-R_INT-thick_7.pdf?src-supplier=Digikey; ComponentLink5URL: https://datasheet.octopart.com/RC0603JR-0724KL-Yageo-datasheet-164759695.pdf?src-supplier=Future+Electronics; ComponentLink5Description: https://datasheet.octopart.com/RC0603JR-0724KL-Yageo-datasheet-164759695.pdf?src-supplier=Future+Electronics; ComponentLink6URL: http://www.yageo.com/documents/recent/PYu-RC0603_51_RoHS_L_7.pdf?src-supplier=Future+Electronics; ComponentLink6Description: http://www.yageo.com/documents/recent/PYu-RC0603_51_RoHS_L_7.pdf?src-supplier=Future+Electronics
R7 = RC0603FR-07100KL: RES 100K OHM 1% 1/10W 0603; Manufacturer: Yageo; Item Type: Resistors; Value: 100kR; Temperature Coefficient: 100ppm/°C; Voltage Rating (DC): 50V; Power Rating: 100mW; Supplier: Rs; LCSC Part Number: C14675; Manufacturer Part Number: RC0603FR-07100KL; RoHS: Yes; Stock: 27300; Case/Package: 0603; Pins: 2; Case Code (Imperial): 0603; Case Code (Metric): 1608; Min Operating Temperature: -55°C; Max Operating Temperature: 155°C; Tolerance: 1%; Resistor Type: Thick Film; Packaging: Tape and Reel; Voltage Rating: 50V; Termination: SMD/SMT; Number of Terminations: 2; Features: Moisture Resistant; Series: RC; Max Power Dissipation: 100mW; Resistance Tolerance: 1%; Construction: Rectangular; Technology: THICK FILM; Length: 1.6mm; Width: 0.8mm; Height: 0.45mm; Depth: 0.8mm; Reach SVHC Compliant: No; Lead Free: 5697LeadFree; Military Standard: Not; RoHS Compliant: Yes; Supplier Part Number: 2424020; Category: Chip SMD Resistors; Mounting Technology: Surface Mount; Weight: 7.1E-05oz; Package Quantity: 5000; ComponentLink1URL: https://datasheet.ciiva.com/11819/0900766b80f96399-11819227.pdf?src-supplier=Rs; ComponentLink1Description: https://datasheet.ciiva.com/11819/0900766b80f96399-11819227.pdf?src-supplier=Rs; ComponentLink2URL: https://datasheet.ciiva.com/2455/pyu-r-int-thick-7-2455183.pdf?src-supplier=Digikey; ComponentLink2Description: https://datasheet.ciiva.com/2455/pyu-r-int-thick-7-2455183.pdf?src-supplier=Digikey; ComponentLink3URL: https://datasheet.ciiva.com/2455/pyu-r-int-thick-7-2455184.pdf?src-supplier=Digikey; ComponentLink3Description: https://datasheet.ciiva.com/2455/pyu-r-int-thick-7-2455184.pdf?src-supplier=Digikey; ComponentLink4URL: https://datasheet.ciiva.com/2455/pyu-r-int-thick-7-2455182.pdf?src-supplier=Digikey; ComponentLink4Description: https://datasheet.ciiva.com/2455/pyu-r-int-thick-7-2455182.pdf?src-supplier=Digikey
R8 = RC0603JR-070RL: RES 0 OHM JUMPER 1/10W 0603; Manufacturer: Yageo; Resistance: 0mR; Tolerance: 1%; Power Rating: 100mW; Voltage Rating (DC): 50V; Temperature Coefficient: 200ppm/°C; Resistance Tolerance: 5%; Item Type: Resistor; Supplier 1: Digi-Key; Manufacturer Part Number: RC0603JR-070RL; RoHS: Yes; Category: Chip SMD Resistors; Stock 1: 18081776; Pricing 1: 1=0.10000, 10=0.01700, 25=0.01240, 50=0.00960, 100=0.00700, 250=0.00536, 500=0.00430, 1000=0.00316 (USD); Case/Package: 0603; Number of Pins: 2; Contact Plating: Tin,Matte; Case Code (Imperial): 0603; Case Code (Metric): 1608; Size Code: 0603; Min Operating Temperature: -55°C; Max Operating Temperature: 155°C; Resistor Type: Thick Film; Packaging: Tape and Reel; Termination: SMD/SMT; Series: RC; Technology: THICK FILM; Package Quantity: 5000; Voltage Rating: 50V; Features: Moisture Resistant; Max Power Dissipation: 100mW; Number of Terminations: 2; Construction: Rectangular; Length: 1.6mm; Width: 0.8mm; Height: 0.45mm; Depth: 0.8mm; Radiation Hardening: No; Reach SVHC Compliant: No SVHC; Lead Free: Lead Free; RoHS Compliant: Yes; Military Standard: Not; Supplier Part Number 1: 311-0.0GRCT-ND; LCSC Part Number: C95177
R9 = RC0603FR-0722KL: RES 22K OHM 1% 1/10W 0603; Manufacturer: Yageo; Item Type: Resistors; Value: 22kR; Temperature Coefficient: 100ppm/°C; Voltage Rating (DC): 50V; Power Rating: 100mW; Shielding: 202Shielding; Current Rating: 290mA; Supplier: Future Electronics; LCSC Part Number: C114065; Manufacturer Part Number: RC0603FR-0722KL; RoHS: Yes; Stock: 1285000; Pricing: 5000=0.0008, 50000=0.0008, 150000=0.0008, 375000=0.0008, 1000000=0.0007 (USD); Case/Package: 0603; Pins: 2; Case Code (Imperial): 0603; Case Code (Metric): 1608; Min Operating Temperature: -55°C; Max Operating Temperature: 155°C; Tolerance: 1%; Resistor Type: Thick Film; Packaging: Tape and Reel; Voltage Rating: 50V; Package Quantity: 1; Termination: SMD/SMT; Number of Terminations: 2; Max Power Dissipation: 100mW; Features: Moisture Resistant; Series: RC; Resistance Tolerance: 1%; Construction: Rectangular; Voltage Rating (AC): 50V; Diameter: 8.5mm; Length: 0.063inch; Width: 0.031inch; Height: 0.022inch; Depth: 0.8mm; Lead Pitch: 5mm; Radiation Hardening: 5898YesNo; Reach SVHC Compliant: No; Lead Free: 5697LeadFree; Military Standard: Not; RoHS Compliant: Yes; ComponentLink1URL: https://datasheet.ciiva.com/2454/pyu-r-int-thick-7-2454424.pdf?src-supplier=Digikey; ComponentLink1Description: https://datasheet.ciiva.com/2454/pyu-r-int-thick-7-2454424.pdf?src-supplier=Digikey; ComponentLink2URL: https://datasheet.ciiva.com/2454/pyu-r-int-thick-7-2454425.pdf?src-supplier=Digikey; ComponentLink2Description: https://datasheet.ciiva.com/2454/pyu-r-int-thick-7-2454425.pdf?src-supplier=Digikey; ComponentLink3URL: https://datasheet.ciiva.com/2454/pyu-r-int-thick-7-2454423.pdf?src-supplier=Digikey; ComponentLink3Description: https://datasheet.ciiva.com/2454/pyu-r-int-thick-7-2454423.pdf?src-supplier=Digikey; ComponentLink4URL: https://datasheet.ciiva.com/7746/443971-7746303.pdf?src-supplier=Element14; ComponentLink4Description: https://datasheet.ciiva.com/7746/443971-7746303.pdf?src-supplier=Element14; ComponentLink5URL: https://datasheet.ciiva.com/15189/getdatasheetpartid-413247-15189661.pdf?src-supplier=Verical; ComponentLink5Description: https://datasheet.ciiva.com/15189/getdatasheetpartid-413247-15189661.pdf?src-supplier=Verical; ComponentLink6URL: https://datasheet.ciiva.com/7746/1686128-7746302.pdf?src-supplier=Element14; ComponentLink6Description: https://datasheet.ciiva.com/7746/1686128-7746302.pdf?src-supplier=Element14; ComponentLink7URL: https://datasheet.ciiva.com/46412/443971-46412846.pdf?src-supplier=Element14; ComponentLink7Description: https://datasheet.ciiva.com/46412/443971-46412846.pdf?src-supplier=Element14
R10 = RC0603JR-072K7L: RES 2.7K OHM 5% 1/10W 0603; Manufacturer: Yageo; Item Type: Resistors; Voltage Rating (AC): 50V; Supplier: Digikey; LCSC Part Number: C127451; Manufacturer Part Number: RC0603JR-072K7L; RoHS: Yes; Stock: 1341093; Pricing: 1=0.1, 10=0.006, 50=0.0056, 100=0.0051, 500=0.00498 (USD); Lead Free: 5697LeadFree; ComponentLink1URL: https://datasheet.ciiva.com/12555/rc0603-272842-12555110.pdf?src-supplier=Mouser; ComponentLink1Description: https://datasheet.ciiva.com/12555/rc0603-272842-12555110.pdf?src-supplier=Mouser; ComponentLink2URL: https://datasheet.ciiva.com/2452/pyu-r-int-thick-7-2452860.pdf?src-supplier=Digikey; ComponentLink2Description: https://datasheet.ciiva.com/2452/pyu-r-int-thick-7-2452860.pdf?src-supplier=Digikey; ComponentLink3URL: https://datasheet.ciiva.com/2452/pyu-r-int-thick-7-2452861.pdf?src-supplier=Digikey; ComponentLink3Description: https://datasheet.ciiva.com/2452/pyu-r-int-thick-7-2452861.pdf?src-supplier=Digikey; ComponentLink4URL: https://datasheet.ciiva.com/2452/pyu-r-int-thick-7-2452862.pdf?src-supplier=Digikey; ComponentLink4Description: https://datasheet.ciiva.com/2452/pyu-r-int-thick-7-2452862.pdf?src-supplier=Digikey
R11 = 0603WAF1001T5E: 0.1W Thick Film Resistors 75V ±100ppm/℃ ±1% 1kΩ 0603 Chip Resistor - Surface Mount ROHS; Manufacturer: UNI-ROYAL(Uniroyal Elec); Manufacturer Part Number: 0603WAF1001T5E; Package: 0603; LCSC Part Number: C21190; Item Type: Resistor; ComponentLink1Description: LCSC; ComponentLink1URL: https://www.lcsc.com/product-detail/Chip-Resistor-Surface-Mount_UNI-ROYAL-Uniroyal-Elec-0603WAF1001T5E_C21190.html?s_z=n_CRCW06031K00JNEA
R12 = FRL1206FR430TS: 0.25W Thick Film Resistors 500V ±1% ±300ppm/℃ 0.43Ω 1206 Chip Resistor - Surface Mount ROHS; Manufacturer: FOJAN; Manufacturer Part Number: FRL1206FR430TS; Package: 1206; LCSC Part Number: C2934294; Item Type: Resistor; ComponentLink1Description: LCSC; ComponentLink1URL: https://www.lcsc.com/product-detail/Chip-Resistor-Surface-Mount_FOJAN-FRL1206FR430TS_C2934294.html?s_z=n_%2520ERJ-8RQFR43V
R22 = RC0603FR-071K5L: RES 1.5K OHM 1% 1/10W 0603; Manufacturer: Yageo; Voltage Rating (DC): 50V; Resistance: 1.5kR; Temperature Coefficient: 100ppm/°C; Power Rating: 100mW; Item Type: Resistor; Supplier 1: Arrow Electronics; Manufacturer Part Number: RC0603FR-071K5L; RoHS: Yes; Category: Chip SMD Resistors; Stock 1: 15000; Pricing 1: 1=0.00160, 5000=0.00160 (USD); Case/Package: 0603; Number of Pins: 2; Case Code (Metric): 1608; Case Code (Imperial): 0603; Size Code: 0603; Min Operating Temperature: -55°C; Max Operating Temperature: 155°C; Tolerance: 1%; Packaging: Tape and Reel; Resistor Type: Thick Film; Voltage Rating: 50V; Package Quantity: 1; Number of Terminations: 2; Termination: SMD/SMT; Max Power Dissipation: 100mW; Features: Moisture Resistant; Series: RC; Resistance Tolerance: 1%; Construction: Rectangular; Length: 0.063inch; Width: 0.031inch; Height: 0.022inch; Depth: 0.8mm; REACH SVHC: No SVHC; Lead Free: Lead Free; Military Standard: Not; RoHS Compliant: Yes; Supplier Part Number 1: RC0603FR-071K5L; LCSC Part Number: C114668
R23 = RT0805BRD07383KL: RES SMD 383K OHM 0.1% 1/8W 0805; Manufacturer: Yageo; Item Type: Resistors; Supplier: Digikey; LCSC Part Number: C865439; Manufacturer Part Number: RT0805BRD07383KL; RoHS: Yes; Pricing: 5000=0.04379 (USD); ComponentLink1URL: https://datasheet.ciiva.com/12706/pyu-rt-1-to-0-05-rohs-l-4-12706709.pdf?src-supplier=Mouser; ComponentLink1Description: https://datasheet.ciiva.com/12706/pyu-rt-1-to-0-05-rohs-l-4-12706709.pdf?src-supplier=Mouser; ComponentLink2URL: https://datasheet.ciiva.com/8885/pyu-rt-1-to-0-05-rohs-l-4-8885958.pdf?src-supplier=Avnet; ComponentLink2Description: https://datasheet.ciiva.com/8885/pyu-rt-1-to-0-05-rohs-l-4-8885958.pdf?src-supplier=Avnet
R24 = RC0603FR-0744K2L: RES 44.2K OHM 1% 1/10W 0603; Manufacturer: Yageo; Item Type: Resistors; Voltage Rating (DC): 50V; Supplier: Digikey; LCSC Part Number: C95684; Manufacturer Part Number: RC0603FR-0744K2L; RoHS: Yes; Stock: 163731; Pricing: 1=0.1, 10=0.009, 100=0.0071, 1000=0.00612, 2500=0.00461 (USD); Lead Free: 5697LeadFree; ComponentLink1URL: https://datasheet.ciiva.com/11819/0900766b80f96399-11819371.pdf?src-supplier=Rs; ComponentLink1Description: https://datasheet.ciiva.com/11819/0900766b80f96399-11819371.pdf?src-supplier=Rs; ComponentLink2URL: https://datasheet.ciiva.com/2455/pyu-r-int-thick-7-2455152.pdf?src-supplier=Digikey; ComponentLink2Description: https://datasheet.ciiva.com/2455/pyu-r-int-thick-7-2455152.pdf?src-supplier=Digikey; ComponentLink3URL: https://datasheet.ciiva.com/2455/pyu-r-int-thick-7-2455153.pdf?src-supplier=Digikey; ComponentLink3Description: https://datasheet.ciiva.com/2455/pyu-r-int-thick-7-2455153.pdf?src-supplier=Digikey; ComponentLink4URL: https://datasheet.ciiva.com/2455/pyu-r-int-thick-7-2455154.pdf?src-supplier=Digikey; ComponentLink4Description: https://datasheet.ciiva.com/2455/pyu-r-int-thick-7-2455154.pdf?src-supplier=Digikey
U1 = UCC28740DR: IC OFFLINE SWITCH FLYBACK 7SOIC; Manufacturer: Texas Instruments; Supplier: Mouser; LCSC Part Number: C182073; Manufacturer Part Number: UCC28740DR; RoHS: Yes; Item Type: IC; Stock: 12848; Pricing: 1=1.11, 10=0.8, 50=0.723, 100=0.638, 1000=0.532, 10000=0.496 (USD); Length: 4.9mm; Width: 3.91mm; Height: 1.75mm; Thickness: 1.58mm; Lead Free: 5697LeadFree; ComponentLink1URL: https://datasheet.ciiva.com/24018/slusbf3a-284800-24018902.pdf?src-supplier=Mouser; ComponentLink1Description: https://datasheet.ciiva.com/24018/slusbf3a-284800-24018902.pdf?src-supplier=Mouser; ComponentLink2URL: https://datasheet.ciiva.com/30018/ucc28740-30018278.pdf?src-supplier=Avnet; ComponentLink2Description: https://datasheet.ciiva.com/30018/ucc28740-30018278.pdf?src-supplier=Avnet; ComponentLink3URL: https://datasheet.ciiva.com/29610/ucc28740-29610346.pdf?src-supplier=Digikey; ComponentLink3Description: https://datasheet.ciiva.com/29610/ucc28740-29610346.pdf?src-supplier=Digikey
U2 = LTV-817S-TA1-C: OPTOISOLATOR 5KV 1CH TRANS 4-SMD; Manufacturer: Vishay Lite-On; Item Type: Optocouplers; Number of Channels: 1; Reverse Breakdown Voltage: 6V; Forward Voltage: 1.4V; Forward Current: 50mA; Rise Time: 18000ns; Max Power Dissipation: 200mW; Collector Emitter Voltage (VCEO): 35V; Collector Emitter Saturation Voltage: 200mV; Power Dissipation: 70mW; Current Transfer Ratio: 400%; Input Type: DC; Supplier: Digikey; LCSC Part Number: C109227; Manufacturer Part Number: LTV-817S-TA1-C; RoHS: Yes; Stock: 4949; Pricing: 1=0.5, 10=0.291, 100=0.1856, 500=0.14438 (USD); Mounting Technology: Surface Mount; Case/Package: SMD/SMT; Pins: 4; Min Operating Temperature: -30°C; Max Operating Temperature: 110°C; Packaging: Tape and Reel; Package Quantity: 1000; Max Collector Current: 50mA; Max Output Voltage: 35V; Output Current per Channel: 50mA; Number of Elements: 1; Fall Time: 18000ns; Isolation Voltage: 5kV; Max Input Current: 50mA; Series: -; Collector-emitter Voltage-Max: 200mV; Isolation Voltage-Max: 5kV; Radiation Hardening: No; Lead Free: Lead Free; ComponentLink1URL: https://datasheet.ciiva.com/12240/ltv-817-827-847-12240648.pdf?src-supplier=Mouser; ComponentLink1Description: https://datasheet.ciiva.com/12240/ltv-817-827-847-12240648.pdf?src-supplier=Mouser; ComponentLink2URL: https://datasheet.ciiva.com/2958/s-110-ltv-817m-s-s-ta-s-ta1-s-tpseries20130925-2958797.pdf?src-supplier=Digikey; ComponentLink2Description: https://datasheet.ciiva.com/2958/s-110-ltv-817m-s-s-ta-s-ta1-s-tpseries20130925-2958797.pdf?src-supplier=Digikey
U3 = TL431BQDBZT: IC VREF SHUNT ADJ 0.5% SOT23-3; Manufacturer: Texas Instruments; Max Supply Voltage: 37V; Output Voltage: 36V; Max Output current: 100mA; Min Output Voltage: 2.495V; Cathode Current: 700uA; Temperature Coefficient: 92ppm/°C; Reference Type: Shunt,Adjustable; Output Type: Adjustable; Supplier: Mouser; LCSC Part Number: C2864384; Manufacturer Part Number: TL431BQDBZT; RoHS: Yes; Item Type: IC; Stock: 34135; Pricing: 1=0.88, 10=0.633, 50=0.57, 100=0.501, 1000=0.415, 10000=0.397 (USD); Case/Package: SOT-23-3; Pins: 3; Min Operating Temperature: -40°C; Max Operating Temperature: 125°C; Tolerance: 0.5%; Packaging: Tape and Reel; Package Quantity: 250; Max Output Voltage: 36V; Output Current: 100mA; Series: -; Reference Voltage: 36V; Thickness: 1mm; Radiation Hardening: No; Lead Free: Lead Free; RoHS Compliant: Yes; ComponentLink1URL: https://datasheet.ciiva.com/15148/getdatasheetpartid-48480-15148279.pdf?src-supplier=Verical; ComponentLink1Description: https://datasheet.ciiva.com/15148/getdatasheetpartid-48480-15148279.pdf?src-supplier=Verical; ComponentLink2URL: https://datasheet.ciiva.com/2012/tl431a-2012112.pdf?src-supplier=Digikey; ComponentLink2Description: https://datasheet.ciiva.com/2012/tl431a-2012112.pdf?src-supplier=Digikey; ComponentLink3URL: https://datasheet.ciiva.com/2012/tl431a-2012111.pdf?src-supplier=Digikey; ComponentLink3Description: https://datasheet.ciiva.com/2012/tl431a-2012111.pdf?src-supplier=Digikey; ComponentLink4URL: https://datasheet.ciiva.com/2012/tl431a-2012113.pdf?src-supplier=Digikey; ComponentLink4Description: https://datasheet.ciiva.com/2012/tl431a-2012113.pdf?src-supplier=Digikey; ComponentLink5URL: https://datasheet.ciiva.com/14366/tl432b-14366103.pdf?src-supplier=Avnet; ComponentLink5Description: https://datasheet.ciiva.com/14366/tl432b-14366103.pdf?src-supplier=Avnet

## Nets that join several sheets
24V: DRIVER_BUC_Sheet (10 pins), Main_Power_Sheet (6 pins)
GND: DRIVER_BUC_Sheet (22 pins), Main_Power_Sheet (10 pins)